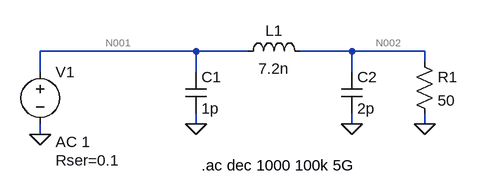
[diagram p0: schematic TX_Filter_Ideal.asc]
TX_Filter_Ideal.asc, the LTspice schematic file:
Version 4.1
SHEET 1 880 680
WIRE 208 112 -32 112
WIRE 288 112 208 112
WIRE 448 112 368 112
WIRE 560 112 448 112
WIRE 560 128 560 112
WIRE -32 144 -32 112
WIRE 208 144 208 112
WIRE 448 144 448 112
WIRE 208 224 208 208
WIRE 448 224 448 208
WIRE 560 224 560 208
WIRE -32 240 -32 224
FLAG -32 240 0
FLAG 208 224 0
FLAG 448 224 0
FLAG 560 224 0
SYMBOL voltage -32 128 R0
WINDOW 123 24 124 Left 2
WINDOW 39 24 152 Left 2
SYMATTR Value2 AC 1
SYMATTR SpiceLine Rser=0.1
SYMATTR InstName V1
SYMATTR Value ""
SYMBOL ind 272 128 R270
WINDOW 0 32 56 VTop 2
WINDOW 3 5 56 VBottom 2
SYMATTR InstName L1
SYMATTR Value 7.2n
SYMATTR SpiceLine Rser=1m
SYMBOL cap 192 144 R0
SYMATTR InstName C1
SYMATTR Value 1p
SYMBOL cap 432 144 R0
SYMATTR InstName C2
SYMATTR Value 2p
SYMBOL res 544 112 R0
SYMATTR InstName R1
SYMATTR Value 50
TEXT 216 288 Left 2 !.ac dec 1000 100k 5G

The netlist it stands for:
* TX_Filter_Ideal.asc
V1 N001 0 AC 1 Rser=0.1
L1 N001 N002 7.2n Rser=1m
C1 N001 0 1p
C2 N002 0 2p
R1 N002 0 50
.ac dec 1000 100k 5G
.backanno
.end

* Results of the author's LTspice run, read from the files saved beside the schematic
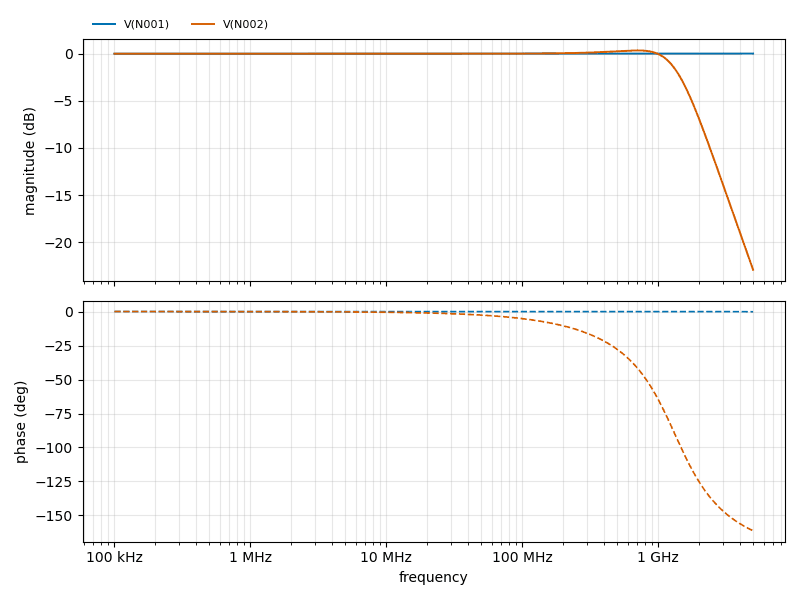
[diagram p1: AC Analysis of TX_Filter_Ideal.asc, plotted from the saved traces]
* AC Analysis, 1 run:
*   V(N001): -0.02 dB at 100 kHz, -0.00 dB at 5 GHz, peak -0.00 dB at 5 GHz
*   V(N002): -0.02 dB at 100 kHz, -22.90 dB at 5 GHz, peak 0.34 dB at 701.5 MHz, 3 dB below the peak at 1.478 GHz